# EasyEDA Pro project EVA_RT.eprj, board VISION_2_Adapter
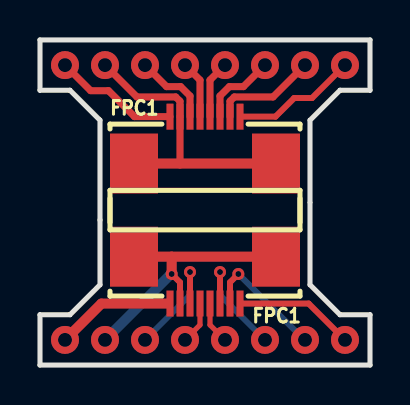
[diagram p16: board, top side]
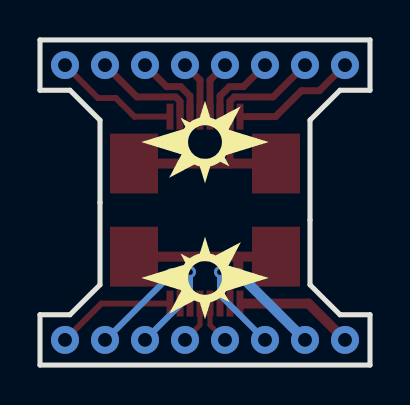
[diagram p17: board, bottom side, seen from below]

Outline 16.5 x 16.3 mm; copper layers: Top Layer, Bottom Layer. Coordinates in mm from the lower left corner of the outline.
Outline path: 0,16.3 16.5,16.3 16.5,13.77 15,13.77 13.5,12.27 13.5,4.02 15,2.52 16.5,2.52 16.5,0 0,0 0,2.52 1.5,2.52 3,4.02 3,12.27 1.5,13.77 0,13.77 0,16.3
Stack: Top Layer 0.035mm - / Dielectric1 1.51mm FR4 er 4.5 / Bottom Layer 0.035mm -

## Design rules (mm)
template: JLCPCB Capability(Two Layers Board)
spacing copperThickness1oz (default): track to track 0.102, other pairs 0.152 to 0.3
spacing copperThickness2oz: track to track 0.203, other pairs 0.152 to 0.3
track width copperThickness1oz (default): min 0.127, default 0.254, max 2.54
track width copperThickness2oz: min 0.203, default 0.254, max 2.54
differential pair differentialPair (default): width min 0.127, default 0.254, max 2.54; gap min 0.152, default 0.152
via viaSize (default): diameter min 0.5, default 0.61, max 10; hole min 0.3, default 0.305, max 6.3

## Placement (name value [footprint] x y rotation side)
FPC1  -  [FFC-SMD_FFC05001-08SBA124W5M]  8.25 11.28 0 top
FPC1#2  -  [FFC-SMD_FFC05001-08SBA124W5M]  8.25 4.26 180 top

## Footprints (pads in the part's own frame, mm; a bottom-side part is the same pattern mirrored in y, then rotated)
FFC-SMD_FFC05001-08SBA124W5M
  rect 0.35x1.3 smd: 1(1.75,1.175) 2(1.25,1.175) 3(0.75,1.175) 4(0.25,1.175) 5(-0.25,1.175) 6(-0.75,1.175) 7(-1.25,1.175) 8(-1.75,1.175)
  rect 2.4x3 smd: 9(-3.55,-1.175) 10(3.55,-1.175)

## Nets

Pads without a net: FPC1 1 2 3 4 5 6 7 8 9 10; FPC1#2 1 2 3 4 5 6 7 8 9 10

## Via types
v1: diameter 1.4, hole 0.7, Top Layer to Bottom Layer, 16 vias
v2: diameter 0.6, hole 0.3, Top Layer to Bottom Layer, 4 vias

## Routing (per net, layer and track width the routed paths; a pad name or vN(x,y) marks a point on that pad's centre or on a via; arc(x,y) is an arc through that point)
(no net): length 95
  Top Layer w0.254: 13.1,1.41 13.1,1.26 ; FPC1#2.4 8,2.01 v1(7.25,1.26) ; FPC1#2.5 8.5,2.01 v1(9.25,1.26)
  Top Layer w0.3: v1(15.25,1.26) 13.43,3.08 FPC1#2.8 ; v2(9.92,4.56) 9.5,4.15 FPC1#2.7 ; v2(7.5,4.66) FPC1#2.3 ; v2(9,4.66) FPC1#2.6 ; v2(6.58,4.56) 7,4.15 FPC1#2.2 ; FPC1.1 11.78,12.45 12.71,13.38 13.6,13.38 v1(15.25,15.04)
  Top Layer w0.35: FPC1.6 7.5,13.49 7.03,13.96 6.33,13.96 v1(5.25,15.04) ; v1(13.25,15.04) 11.65,13.44 9.71,13.44 9.5,13.23 FPC1.2 ; FPC1.3 9,13.49 9.47,13.96 10.17,13.96 v1(11.25,15.04) ; v1(1.25,15.04) 2.53,13.75 3.42,13.75 4.72,12.45 FPC1.8 ; FPC1.5 8,14.29 v1(7.25,15.04) ; v1(9.25,15.04) 8.5,14.29 FPC1.4 ; v1(3.25,15.04) 4.85,13.44 6.79,13.44 7,13.23 FPC1.7 7,10.1
  Top Layer w0.5: FPC1.9 FPC1.10 ; FPC1#2.10 6.58,5.43 ; 6.58,5.43 v2(6.58,4.56) ; 6.58,5.43 FPC1#2.9 ; v1(1.25,1.26) 3.07,3.08 6.37,3.08
  Bottom Layer w0.3: v1(11.25,1.26) 9,3.51 v2(9,4.66) ; 13.1,1.26 13.1,1.38 v2(9.92,4.56) ; v1(5.25,1.26) 7.5,3.51 v2(7.5,4.66)
  Bottom Layer w0.5: v2(6.58,4.56) 6.55,4.56 v1(3.25,1.26)
  vias: v1(13.25,1.26)
